# Altium schematic sheet Top_Sheet.SchDoc
size A4; SheetNumber: 1
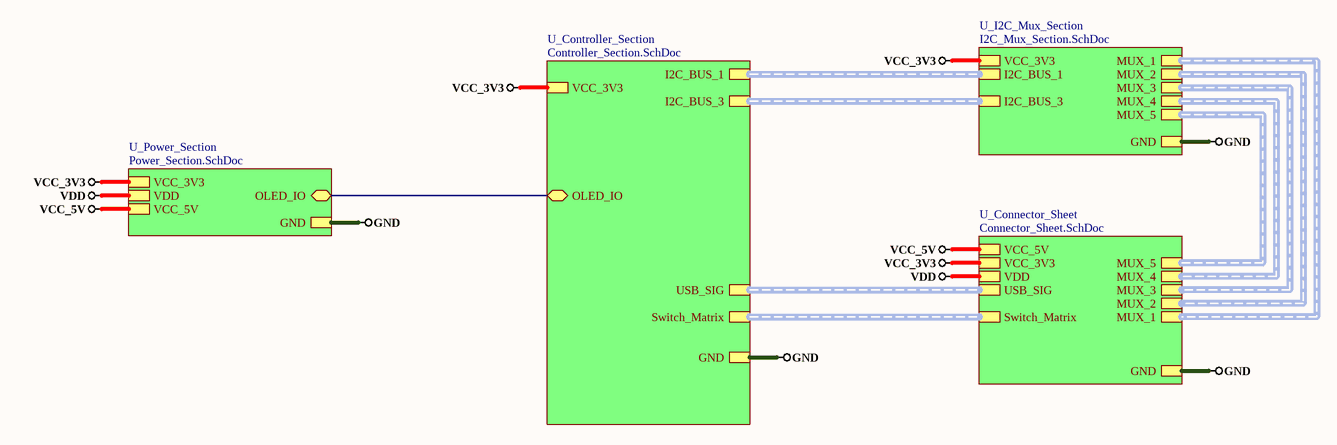
[diagram p0: Top_Sheet.SchDoc]

## Sub-sheets
U_Connector_Sheet = Connector_Sheet.SchDoc: USB_SIG (harness USB_SIG), GND, VCC_5V, MUX_1 (harness MUX_1), MUX_2 (harness MUX_2), MUX_3 (harness MUX_3), MUX_4 (harness MUX_4), MUX_5 (harness MUX_5), Switch_Matrix (harness Switch_Matrix), VCC_3V3, VDD
U_Controller_Section = Controller_Section.SchDoc: USB_SIG (harness USB_SIG), VCC_3V3, GND, I2C_BUS_1 (harness I2C_BUS_1), I2C_BUS_3 (harness I2C_BUS_3), Switch_Matrix (harness Switch_Matrix), OLED_IO (bidir)
U_I2C_Mux_Section = I2C_Mux_Section.SchDoc: VCC_3V3, GND, I2C_BUS_1 (harness I2C_BUS_1), I2C_BUS_3 (harness I2C_BUS_3), MUX_1 (harness MUX_1), MUX_2 (harness MUX_2), MUX_3 (harness MUX_3), MUX_4 (harness MUX_4), MUX_5 (harness MUX_5)
U_Power_Section = Power_Section.SchDoc: VCC_3V3, GND, VCC_5V, OLED_IO (bidir), VDD

## Nets
GND: sheet U_Controller_Section/GND, sheet U_I2C_Mux_Section/GND, sheet U_Power_Section/GND, sheet U_Connector_Sheet/GND
VCC_3V3: sheet U_Controller_Section/VCC_3V3, sheet U_I2C_Mux_Section/VCC_3V3, sheet U_Power_Section/VCC_3V3, sheet U_Connector_Sheet/VCC_3V3
VCC_5V: sheet U_Power_Section/VCC_5V, sheet U_Connector_Sheet/VCC_5V
VDD: sheet U_Power_Section/VDD, sheet U_Connector_Sheet/VDD
(unnamed): sheet U_Controller_Section/OLED_IO, sheet U_Power_Section/OLED_IO

## Buses and harness runs
harness sheet U_Connector_Sheet/MUX_1 = sheet U_I2C_Mux_Section/MUX_1
harness sheet U_Connector_Sheet/MUX_2 = sheet U_I2C_Mux_Section/MUX_2
harness sheet U_Connector_Sheet/MUX_3 = sheet U_I2C_Mux_Section/MUX_3
harness sheet U_Connector_Sheet/MUX_4 = sheet U_I2C_Mux_Section/MUX_4
harness sheet U_Connector_Sheet/MUX_5 = sheet U_I2C_Mux_Section/MUX_5
harness sheet U_Connector_Sheet/Switch_Matrix = sheet U_Controller_Section/Switch_Matrix
harness sheet U_Connector_Sheet/USB_SIG = sheet U_Controller_Section/USB_SIG
harness sheet U_Controller_Section/I2C_BUS_1 = sheet U_I2C_Mux_Section/I2C_BUS_1
harness sheet U_Controller_Section/I2C_BUS_3 = sheet U_I2C_Mux_Section/I2C_BUS_3